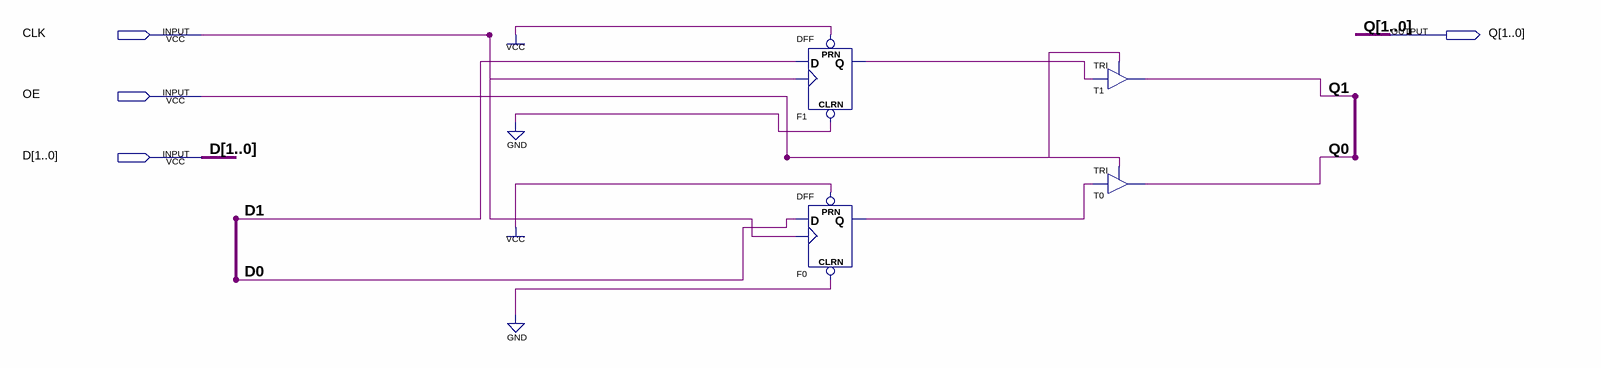
[diagram p0: schematic sheet]
// Quartus schematic REG2.bdf as structural Verilog: 4 symbols, 4 pins
module REG2 (
  input  CLK,
  input  OE,
  input  [1:0] D,
  output [1:0] Q
);

  wire F0_q, F1_q;

  DFF F1 (.CLRN(1'b0), .CLK(CLK), .D(D[1]), .PRN(1'b1), .Q(F1_q));
  DFF F0 (.CLRN(1'b0), .CLK(CLK), .D(D[0]), .PRN(1'b1), .Q(F0_q));
  TRI T1 (.IN(F1_q), .OE(OE), .OUT(Q[1]));
  TRI T0 (.IN(F0_q), .OE(OE), .OUT(Q[0]));
endmodule
